# Altium schematic sheet Mini Project 1.SchDoc
size A; SheetNumber: 1; SheetTotal: 1
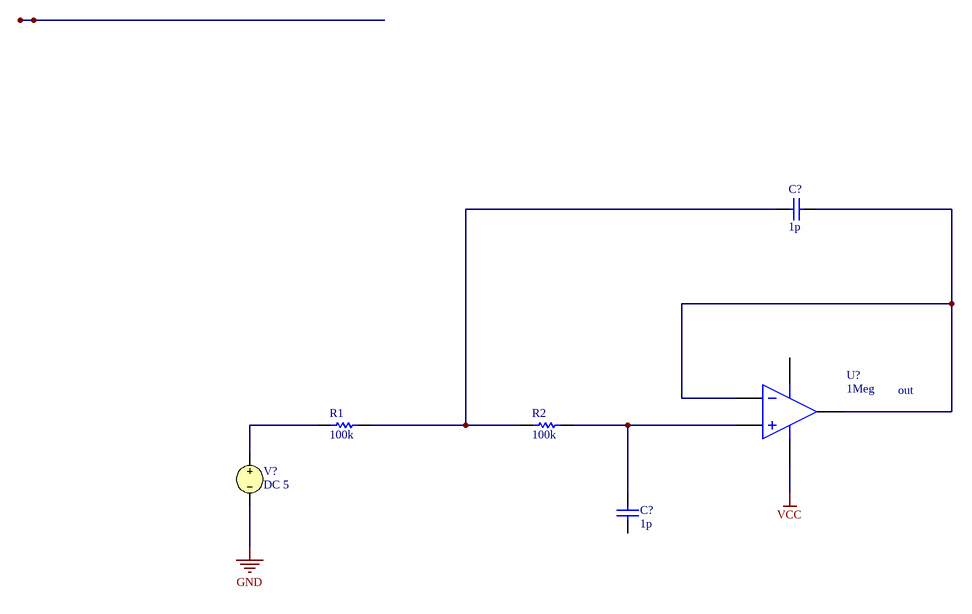
[diagram p0: Mini Project 1.SchDoc]

## Parts
(Parts that share a designator on the sheet are numbered #1, #2 ... from top to bottom, then left to right.)
C?#1  value 1p  (hidden comment: Capacitor)
C?#2  value 1p  (hidden comment: Capacitor)
R1  value 100k  (hidden comment: Resistor)
R2  value 100k  (hidden comment: Resistor)
U?  GAIN: 1Meg  (hidden comment: Ideal Operational Amplifier)
V?  DC 5

## Nets
GND: V?.2
VCC: U?.5(V-)
NetC?#1_1: C?#1.1 R1.2 R2.1
NetC?#1_2: C?#1.2 U?.1(IN-) U?.3(OUT)
NetC?#2_2: C?#2.2 R2.2 U?.2(IN+)
NetR1_1: R1.1 V?.1

Not connected (* = marked no-connect by the designer): C?#2 1; U? 4(V+)

## Notes on the sheet
- out

## Library data of the parts
C?#1 C?#2 = Capacitor: SimulationGenericComponent: True
R1 R2 = Resistor: TC1: 0; SimulationGenericComponent: True; TC2: 0
U? = OpAmp with power terminals: SimulationGenericComponent: True
V? = VSRC: Voltage Source; Note: PCB Footprint - Not required; AC Magnitude: 1; AC Phase: 0; Value: 5; Published: 8-Jun-2000; LatestRevisionDate: 17-Jul-2002; LatestRevisionNote: Re-released for DXP Platform.; PackageReference: Not Applicable; Publisher: Altium Limited